# Altium project Master-Board-v2.0.PrjPcb (part 7 of 11)

## Sheet CAN-Sheet.SchDoc
size 420 x 297 mm; SheetNumber: 10; SheetTotal: 15
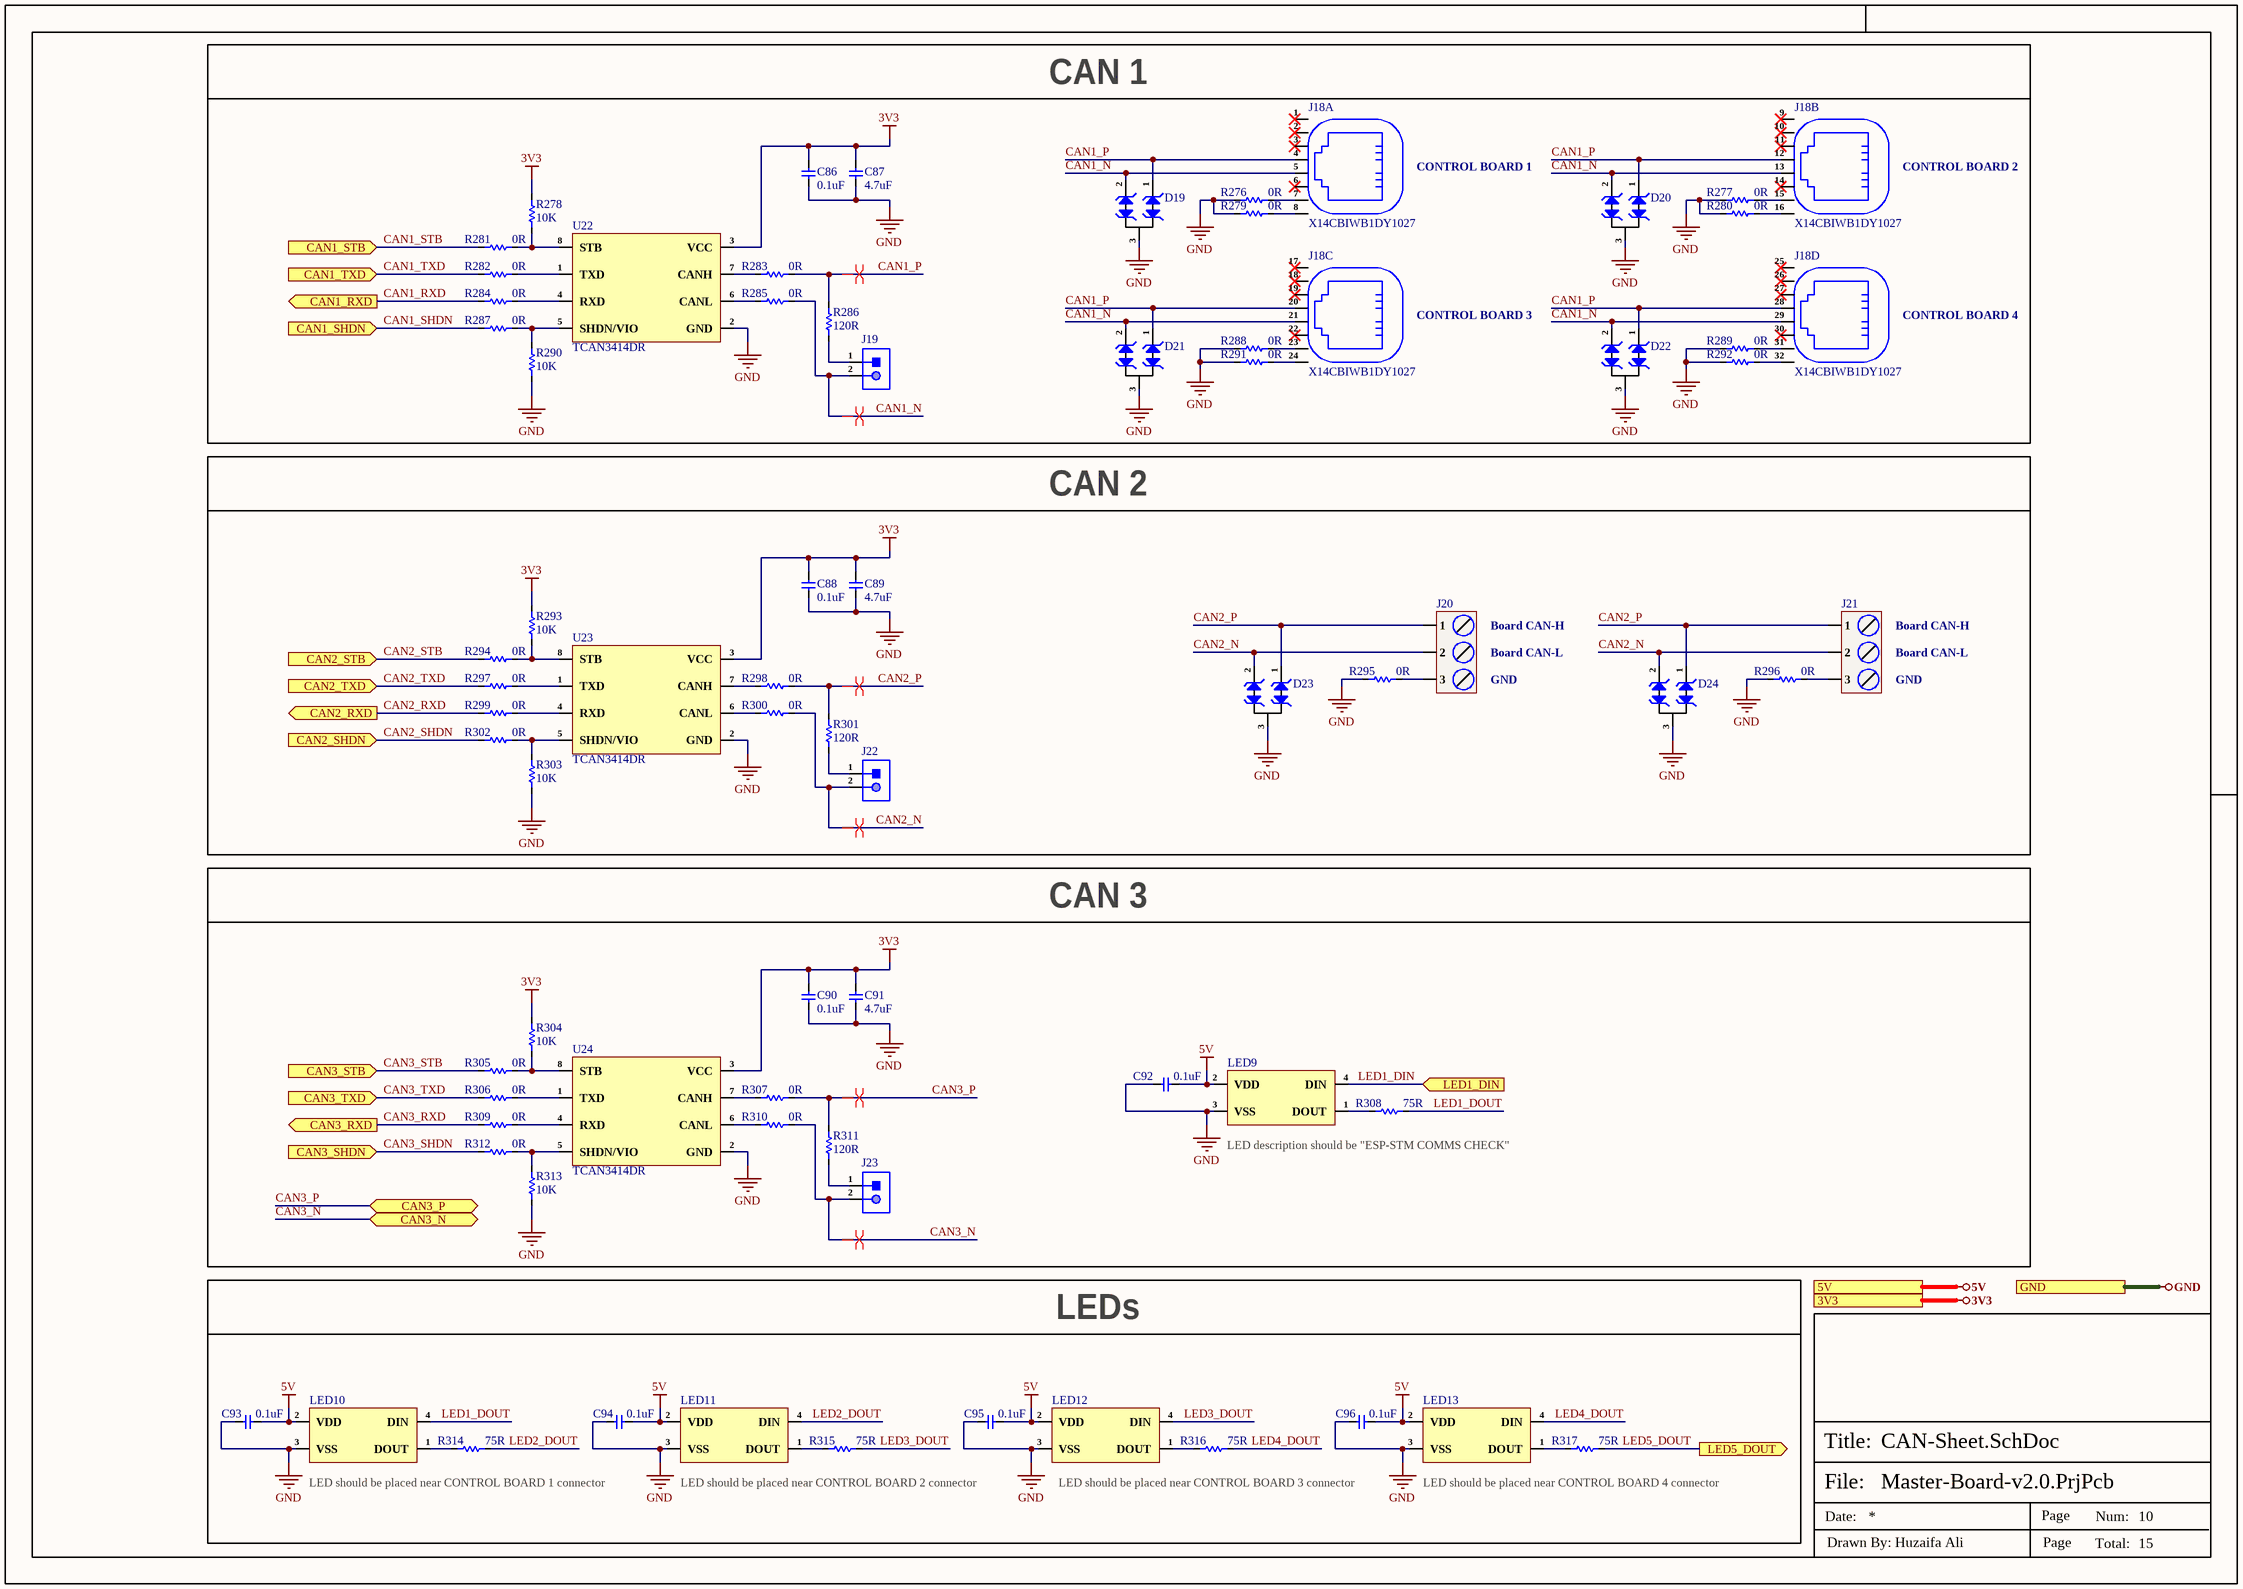
[diagram p6: CAN-Sheet.SchDoc]

### Parts
C86  0.1uF  [Cap-0402]
C87  4.7uF  [Cap-0402]
C88  0.1uF  [Cap-0402]
C89  4.7uF  [Cap-0402]
C90  0.1uF  [Cap-0402]
C91  4.7uF  [Cap-0402]
C92  0.1uF  [Cap-0402]
C93  0.1uF  [Cap-0402]
C94  0.1uF  [Cap-0402]
C95  0.1uF  [Cap-0402]
C96  0.1uF  [Cap-0402]
D19  CDSOT23-T24CAN-Q  [SOT-23]  (value not drawn)
D20  CDSOT23-T24CAN-Q  [SOT-23]  (value not drawn)
D21  CDSOT23-T24CAN-Q  [SOT-23]  (value not drawn)
D22  CDSOT23-T24CAN-Q  [SOT-23]  (value not drawn)
D23  CDSOT23-T24CAN-Q  [SOT-23]  (value not drawn)
D24  CDSOT23-T24CAN-Q  [SOT-23]  (value not drawn)
J18  X14CBIWB1DY1027  [X14CBIWB1DY1027]  (parts A,B,C,D of 4)
J19  X6511WV-02H-C60D30  [HDR1X2_]  (value not drawn)
J20  DB128L-5.08-3P-BK-S  [DB128L-5.08-3P-BK-S]  (value not drawn)
J21  DB128L-5.08-3P-BK-S  [DB128L-5.08-3P-BK-S]  (value not drawn)
J22  X6511WV-02H-C60D30  [HDR1X2_]  (value not drawn)
J23  X6511WV-02H-C60D30  [HDR1X2_]  (value not drawn)
LED9  WS2812D-F5  [WS2812D-F5]  (value not drawn)
LED10  WS2812D-F5  [WS2812D-F5]  (value not drawn)
LED11  WS2812D-F5  [WS2812D-F5]  (value not drawn)
LED12  WS2812D-F5  [WS2812D-F5]  (value not drawn)
LED13  WS2812D-F5  [WS2812D-F5]  (value not drawn)
R276  0R  [Res-0402]
R277  0R  [Res-0402]
R278  10K  [Res-0402]
R279  0R  [Res-0402]
R280  0R  [Res-0402]
R281  0R  [Res-0402]
R282  0R  [Res-0402]
R283  0R  [Res-0402]
R284  0R  [Res-0402]
R285  0R  [Res-0402]
R286  120R  [Res-0603]
R287  0R  [Res-0402]
R288  0R  [Res-0402]
R289  0R  [Res-0402]
R290  10K  [Res-0402]
R291  0R  [Res-0402]
R292  0R  [Res-0402]
R293  10K  [Res-0402]
R294  0R  [Res-0402]
R295  0R  [Res-0402]
R296  0R  [Res-0402]
R297  0R  [Res-0402]
R298  0R  [Res-0402]
R299  0R  [Res-0402]
R300  0R  [Res-0402]
R301  120R  [Res-0603]
R302  0R  [Res-0402]
R303  10K  [Res-0402]
R304  10K  [Res-0402]
R305  0R  [Res-0402]
R306  0R  [Res-0402]
R307  0R  [Res-0402]
R308  75R  [Res-0402]
R309  0R  [Res-0402]
R310  0R  [Res-0402]
R311  120R  [Res-0603]
R312  0R  [Res-0402]
R313  10K  [Res-0402]
R314  75R  [Res-0402]
R315  75R  [Res-0402]
R316  75R  [Res-0402]
R317  75R  [Res-0402]
U22  TCAN3414DR  [SOIC-8(0.154", 3.90mm Width)]
U23  TCAN3414DR  [SOIC-8(0.154", 3.90mm Width)]
U24  TCAN3414DR  [SOIC-8(0.154", 3.90mm Width)]

### Blocks framed on the sheet
CAN 1: C86 C87 D19-D22 J18 J19 R276-R292 U22
CAN 2: C88 C89 D23 D24 J20-J22 R293-R303 U23
CAN 3: C90-C92 J23 LED9 R304-R313 U24
LEDs: C93-C96 LED10-LED13 R314-R317

### Ports
3V3 (see Top-Sheet[2C], Controller-Sheet-1[4D], Controller-Sheet-2[4D], Controller-Sheet-3[4D], DIOs-Lights-Sensors-Sheet[4D], Display-Sheet[5D], ESP32_Sheet[6D], EtherCAT-Sheet[1D], Ethernet-Sheet[5D], Power-Sheet[4D], RS232-Sheet[5D], RS485-Sheet[5D], STM32-USB-Sheet[4D]), 5V (see Top-Sheet[2C], Analog-AIO-Sheet[5D], Controller-Sheet-2[4D], Controller-Sheet-3[4D], DIOs-Lights-Sensors-Sheet[4D], Display-Sheet[5D], Power-Sheet[4D], RS232-Sheet[5D], RS485-Sheet[5D], STM32-USB-Sheet[4D]), CAN1_RXD (out, see Top-Sheet[2C]), CAN1_SHDN (in, see Top-Sheet[2C]), CAN1_STB (in, see Top-Sheet[2C]), CAN1_TXD (in, see Top-Sheet[2C]), CAN2_RXD (out, see Top-Sheet[2D]), CAN2_SHDN (in, see Top-Sheet[2C]), CAN2_STB (in, see Top-Sheet[2D]), CAN2_TXD (in, see Top-Sheet[2D]), CAN3_N (bidir, see Top-Sheet[2C]), CAN3_P (bidir, see Top-Sheet[2C]), CAN3_RXD (out, see Top-Sheet[2D]), CAN3_SHDN (in, see Top-Sheet[2D]), CAN3_STB (in, see Top-Sheet[2D]), CAN3_TXD (in, see Top-Sheet[2D]), GND (see Top-Sheet[2C], Analog-AIO-Sheet[5D], Controller-Sheet-1[4D], Controller-Sheet-2[4D], Controller-Sheet-3[4D], DIOs-Lights-Sensors-Sheet[4D], Display-Sheet[5D], ESP32_Sheet[6D], EtherCAT-Sheet[1D], Ethernet-Sheet[5D], Power-Sheet[4D], RS232-Sheet[5D], RS485-Sheet[5D], STM32-USB-Sheet[4D]), LED1_DIN (in, see Top-Sheet[2D]), LED5_DOUT (out, see Top-Sheet[2D], RS232-Sheet[5B])

### Nets
3V3: C86.2 C87.2 C88.2 C89.2 C90.2 C91.2 R278.2 R293.2 R304.2 U22.3(VCC) U23.3(VCC) U24.3(VCC) ; port 3V3
5V: C92.2 C93.2 C94.2 C95.2 C96.2 LED9.2(VDD) LED10.2(VDD) LED11.2(VDD) LED12.2(VDD) LED13.2(VDD) ; port 5V
GND: C86.1 C87.1 C88.1 C89.1 C90.1 C91.1 C92.1 C93.1 C94.1 C95.1 C96.1 D19.3 D20.3 D21.3 D22.3 D23.3 D24.3 LED9.3(VSS) LED10.3(VSS) LED11.3(VSS) LED12.3(VSS) LED13.3(VSS) R276.1 R277.1 R279.1 R280.1 R288.1 R289.1 R290.1 R291.1 R292.1 R295.1 R296.1 R303.1 R313.1 U22.2(GND) U23.2(GND) U24.2(GND) ; port GND
CAN1_N: D19.2 D20.2 D21.2 D22.2 J18.5 J18.13 J18.21 J18.29 J19.2 R285.2
CAN1_P: D19.1 D20.1 D21.1 D22.1 J18.4 J18.12 J18.20 J18.28 R283.2 R286.2
CAN1_RXD: R284.1 ; port CAN1_RXD
CAN1_SHDN: R287.1 ; port CAN1_SHDN
CAN1_STB: R281.1 ; port CAN1_STB
CAN1_TXD: R282.1 ; port CAN1_TXD
CAN2_N: D23.2 D24.2 J20.2 J21.2 J22.2 R300.2
CAN2_P: D23.1 D24.1 J20.1 J21.1 R298.2 R301.2
CAN2_RXD: R299.1 ; port CAN2_RXD
CAN2_SHDN: R302.1 ; port CAN2_SHDN
CAN2_STB: R294.1 ; port CAN2_STB
CAN2_TXD: R297.1 ; port CAN2_TXD
CAN3_N: J23.2 R310.2 ; port CAN3_N  [project net CAN0_N]
CAN3_P: R307.2 R311.2 ; port CAN3_P  [project net CAN0_P]
CAN3_RXD: R309.1 ; port CAN3_RXD
CAN3_SHDN: R312.1 ; port CAN3_SHDN
CAN3_STB: R305.1 ; port CAN3_STB
CAN3_TXD: R306.1 ; port CAN3_TXD
LED1_DIN: LED9.4(DIN) ; port LED1_DIN
LED1_DOUT: LED10.4(DIN) R308.2
LED2_DOUT: LED11.4(DIN) R314.2
LED3_DOUT: LED12.4(DIN) R315.2
LED4_DOUT: LED13.4(DIN) R316.2
LED5_DOUT: R317.2 ; port LED5_DOUT
NetJ18_7: J18.7 R276.2
NetJ18_8: J18.8 R279.2
NetJ18_15: J18.15 R277.2
NetJ18_16: J18.16 R280.2
NetJ18_23: J18.23 R288.2
NetJ18_24: J18.24 R291.2
NetJ18_31: J18.31 R289.2
NetJ18_32: J18.32 R292.2
NetJ19_1: J19.1 R286.1
NetJ20_3: J20.3 R295.2
NetJ21_3: J21.3 R296.2
NetJ22_1: J22.1 R301.1
NetJ23_1: J23.1 R311.1
NetLED9_1: LED9.1(DOUT) R308.1
NetLED10_1: LED10.1(DOUT) R314.1
NetLED11_1: LED11.1(DOUT) R315.1
NetLED12_1: LED12.1(DOUT) R316.1
NetLED13_1: LED13.1(DOUT) R317.1
NetR278_1: R278.1 R281.2 U22.8(STB)
NetR282_2: R282.2 U22.1(TXD)
NetR283_1: R283.1 U22.7(CANH)
NetR284_2: R284.2 U22.4(RXD)
NetR285_1: R285.1 U22.6(CANL)
NetR287_2: R287.2 R290.2 U22.5(SHDN/VIO)
NetR293_1: R293.1 R294.2 U23.8(STB)
NetR297_2: R297.2 U23.1(TXD)
NetR298_1: R298.1 U23.7(CANH)
NetR299_2: R299.2 U23.4(RXD)
NetR300_1: R300.1 U23.6(CANL)
NetR302_2: R302.2 R303.2 U23.5(SHDN/VIO)
NetR304_1: R304.1 R305.2 U24.8(STB)
NetR306_2: R306.2 U24.1(TXD)
NetR307_1: R307.1 U24.7(CANH)
NetR309_2: R309.2 U24.4(RXD)
NetR310_1: R310.1 U24.6(CANL)
NetR312_2: R312.2 R313.2 U24.5(SHDN/VIO)

Not connected (* = marked no-connect by the designer): J18 1* 2* 3* 6* 9* 10* 11* 14* 17* 18* 19* 22* 25* 26* 27* 30*

### Layout directives
differential pair; differential pair class CAN: CAN0_N, CAN0_P, CAN1_N, CAN1_P, CAN2_N, CAN2_P

### Notes on the sheet
- CONTROL BOARD 1
- CONTROL BOARD 2
- CONTROL BOARD 3
- CONTROL BOARD 4
- Board CAN-H
- Board CAN-L
- GND
- LED description should be "ESP-STM COMMS CHECK"
- LED should be placed near CONTROL BOARD 1 connector
- LED should be placed near CONTROL BOARD 2 connector
- LED should be placed near CONTROL BOARD 3 connector
- LED should be placed near CONTROL BOARD 4 connector
- File:
- Title:
- Date:
- Page
- Num:
- Total:
- Drawn By: Huzaifa Ali

### Library data of the parts
C86 C88 C90 C92-C96 = CC0402JRX7R7BB104: as C30 on sheet Display-Sheet; Supplier: Digikey; Supplier Part Number: 311-1676-1-ND; Manufacturer Part Number: CC0402JRX7R7BB104; RoHS: Yes; Category: Ceramic Capacitors; Stock: 1659111; Pricing: 1=0.1, 10=0.046, 50=0.0262, 100=0.0203, 500=0.01528, 1000=0.012, 2500=0.01091, 5000=0.01004 (USD); Mounting Technology: Surface Mount; Case/Package: 0402; Case Code (Metric): 1005; Case Code (Imperial): 0402; Min Operating Temperature: -55°C; Max Operating Temperature: 125°C; Dielectric: X7R; Packaging: Tape and Reel; Package Quantity: 10000; Voltage Rating (DC): 16V; Voltage Rating: 16V; Series: CC; Construction: Flat; Length: 0.039inch; Width: 0.02inch; Height: 0.5mm; Thickness: 0.022inch; Lead Free: Lead Free; Halogen Free: Halogen Free; RoHS Compliant: Yes; ComponentLink1URL: https://datasheet.ciiva.com/13210/upy-gphc-x7r-6-3v-to-50v-8-12304-13210152.pdf?src-supplier=Mouser; ComponentLink1Description: https://datasheet.ciiva.com/13210/upy-gphc-x7r-6-3v-to-50v-8-12304-13210152.pdf?src-supplier=Mouser; LCSC Part Number: C541464
C87 C89 C91 = CC0402KRX5R6BB475: as C31 on sheet Display-Sheet; Supplier 1: Farnell; Manufacturer Part Number: CC0402KRX5R6BB475; RoHS: Yes; Category: Ceramic Capacitors; Stock 1: 20000; Pricing 1: 10000=0.02310, 50000=0.02100 (GBP); Mount: Surface Mount; Case/Package: 0402; Case Code (Imperial): 0402; Case Code (Metric): 1005; Min Operating Temperature: -55°C; Max Operating Temperature: 85°C; Packaging: Cut Tape; Capacitance: 4.7uF; Voltage Rating: 10V; RoHS Compliant: Yes; ComponentLink1URL: http://www.yageo.com/documents/recent/UPY-GPHC_X5R_4V-to-50V_25.pdf?src-supplier=Digi-Key; ComponentLink1Description: http://www.yageo.com/documents/recent/UPY-GPHC_X5R_4V-to-50V_25.pdf?src-supplier=Digi-Key; Supplier Part Number 1: 3871698; LCSC Part Number: C326586
D19-D24 = CDSOT23-T24CAN-Q: TVS DIODE 24VWM 40VC SOT23-3; Manufacturer: Bourns; Item Type: TVS Diodes; Supplier: Digikey; LCSC Part Number: C350941; Manufacturer Part Number: CDSOT23-T24CAN-Q; RoHS: Yes; Stock: 17231; Pricing: 1=0.36, 10=0.282, 100=0.1691, 500=0.15656, 1000=0.10645, 3000=0.098, 6000=0.09393, 9000=0.08454, 30000=0.08328, 75000=0.07827 (USD); RoHS Compliant: 5897YesNo; ComponentLink1URL: http://www.farnell.com/datasheets/2372435.pdf?src-supplier=Farnell; ComponentLink1Description: http://www.farnell.com/datasheets/2372435.pdf?src-supplier=Farnell; ComponentLink2URL: https://www.bourns.com/docs/Product-Datasheets/cdsot23-t24can-Q.pdf?src-supplier=Digikey; ComponentLink2Description: https://www.bourns.com/docs/Product-Datasheets/cdsot23-t24can-Q.pdf?src-supplier=Digikey; ComponentLink3URL: http://www.farnell.com/datasheets/2372435.pdf?src-supplier=Newark; ComponentLink3Description: http://www.farnell.com/datasheets/2372435.pdf?src-supplier=Newark
J18 = X14CBIWB1DY1027: RJ45Receptacle 4 Unshielded Bend-in Gold Phosphor Bronze Without LED -40℃~+85℃ Plugin Ethernet Connectors / Modular Connectors (RJ45 RJ11) ROHS; Manufacturer: XKB Connection; Manufacturer Part Number: X14CBIWB1DY1027; Package: Plugin; LCSC Part Number: C2931489; Item Type: Connectors (RJ45 RJ11); ComponentLink1Description: LCSC; ComponentLink1URL: https://www.lcsc.com/product-detail/Ethernet-Connectors-Modular-Connectors-RJ45-RJ11_XKB-Connection-X14CBIWB1DY1027_C2931489.html
J19 J22 J23 = X6511WV-02H-C60D30: Gold 250V 3A Straight Square Pins 2.5mm 2P 260℃ 6mm -40℃~+105℃ 3mm 2.54mm Plugin Black Brass 1x2P Plugin,P=2.54mm Pin Headers ROHS; Manufacturer: XKB; Item Type: Male Header; Manufacturer Part Number: X6511WV-02H-C60D30; Package: Plugin,P=2.54mm; LCSC Part Number: C706874; ComponentLink1Description: LCSC; ComponentLink1URL: https://www.lcsc.com/product-detail/Pin-Headers_XKB-Connectivity-X6511WV-02H-C60D30_C706874.html
J20 J21 = DB128L-5.08-3P-BK-S: 1x3P 18A -40℃~+105℃ 250V Black 12~30 Straight pin 5.08mm 2.5 1 3 Plugin,P=5.08mm Screw terminal ROHS; Manufacturer: DIBO; Item Type: Terminal Block; Manufacturer Part Number: DB128L-5.08-3P-BK-S; Package: Plugin,P=5.08mm; LCSC Part Number: C430602; ComponentLink1Description: LCSC; ComponentLink1URL: https://www.lcsc.com/product-detail/Screw-terminal_DIBO-DB128L-5-08-3P-BK-S_C430602.html
LED9-LED13 = WS2812D-F5: Plugin,D=5mm RGB LEDs ROHS; Manufacturer: Worldsemi; Item Type: RGB LED; Manufacturer Part Number: WS2812D-F5; Package: Plugin,D=5mm; LCSC Part Number: C190565; ComponentLink1Description: LCSC; ComponentLink1URL: https://jlcpcb.com/partdetail/Worldsemi-WS2812DF5/C190565
R276 R277 R279-R285 R287-R289 R291 R292 R294-R300 R302 R305-R307 R309 R310 R312 = RC0402FR-070RL: as R77-R83 on sheet Display-Sheet; Supplier 1: Mouser; Manufacturer Part Number: RC0402FR-070RL; RoHS: Yes; Stock 1: 8556842; Pricing 1: 1=0.10000, 10=0.01400, 50=0.01400, 100=0.00600, 1000=0.00300, 5000=0.00200, 10000=0.00100 (USD); Mount: Surface Mount; Case/Package: 0402; Contact Plating: Tin,Matte; Case Code (Imperial): 0402; Case Code (Metric): 1005; Size Code: 0402; Min Operating Temperature: -55°C; Max Operating Temperature: 155°C; Resistance: 0R; Resistor Type: Thick Film; Packaging: Tape and Reel; Termination: SMD/SMT; Features: Moisture Resistant; Series: RC; Number of Terminations: 2; Length: 1mm; Width: 0.5mm; Height: 0.35mm; Radiation Hardening: No; Lead Free: Lead Free; RoHS Compliant: Yes; ComponentLink1URL: https://datasheet.ciiva.com/8896/pyu-rc0402-51-rohs-l-6-8896149.pdf?src-supplier=Avnet; ComponentLink1Description: https://datasheet.ciiva.com/8896/pyu-rc0402-51-rohs-l-6-8896149.pdf?src-supplier=Avnet; ComponentLink2URL: https://datasheet.ciiva.com/16790/pyu-rc0402-51-rohs-l-6-r-16790444.pdf?src-supplier=Future+Electronics; ComponentLink2Description: https://datasheet.ciiva.com/16790/pyu-rc0402-51-rohs-l-6-r-16790444.pdf?src-supplier=Future+Electronics; Supplier Part Number 1: 603-RC0402FR-070RL; LCSC Part Number: C106231
R278 R290 R293 R303 R304 R313 = RC0402FR-0710KL: as R84 on sheet Display-Sheet; Supplier 1: Mouser; Manufacturer Part Number: RC0402FR-0710KL; RoHS: Yes; Category: Chip SMD Resistors; Stock 1: 18648329; Pricing 1: 1=0.10000, 10=0.01400, 50=0.01400, 100=0.00500, 1000=0.00300, 10000=0.00200 (USD); Case/Package: 0402; Number of Pins: 2; Case Code (Imperial): 0402; Case Code (Metric): 1005; Min Operating Temperature: -55°C; Max Operating Temperature: 155°C; Resistor Type: Thick Film; Tolerance: 1%; Packaging: Tape and Reel; Voltage Rating: 50V; Termination: SMD/SMT; Working Voltage: 50V; Number of Terminations: 2; Features: Moisture Resistant; Series: RC; Resistance Tolerance: 1%; Construction: Rectangular; Length: 1mm; Width: 0.5mm; Height: 0.32mm; Depth: 0.5mm; Lead Pitch: 0.2mm; REACH SVHC: No SVHC; Lead Free: Lead Free; RoHS Compliant: Yes; Military Standard: Not; ComponentLink1URL: https://datasheet.ciiva.com/7660/38568-7660787.pdf?src-supplier=Element14; ComponentLink1Description: https://datasheet.ciiva.com/7660/38568-7660787.pdf?src-supplier=Element14; ComponentLink2URL: https://datasheet.ciiva.com/7849/1686128-7849814.pdf?src-supplier=Element14; ComponentLink2Description: https://datasheet.ciiva.com/7849/1686128-7849814.pdf?src-supplier=Element14; ComponentLink3URL: https://datasheet.ciiva.com/7983/1018594-7983486.pdf?src-supplier=Element14; ComponentLink3Description: https://datasheet.ciiva.com/7983/1018594-7983486.pdf?src-supplier=Element14; ComponentLink4URL: https://datasheet.ciiva.com/22747/1018594-22747512.pdf?src-supplier=Element14; ComponentLink4Description: https://datasheet.ciiva.com/22747/1018594-22747512.pdf?src-supplier=Element14; ComponentLink5URL: https://datasheet.ciiva.com/12667/pyu-rc0402-51-rohs-l-6-r-12667067.pdf?src-supplier=Mouser; ComponentLink5Description: https://datasheet.ciiva.com/12667/pyu-rc0402-51-rohs-l-6-r-12667067.pdf?src-supplier=Mouser; ComponentLink6URL: https://datasheet.ciiva.com/7849/1784430-7849813.pdf?src-supplier=Element14; ComponentLink6Description: https://datasheet.ciiva.com/7849/1784430-7849813.pdf?src-supplier=Element14; ComponentLink7URL: https://datasheet.ciiva.com/7849/1784430-7849815.pdf?src-supplier=Element14; ComponentLink7Description: https://datasheet.ciiva.com/7849/1784430-7849815.pdf?src-supplier=Element14; Supplier Part Number 1: 603-RC0402FR-0710KL; LCSC Part Number: C60490
R286 R301 R311 = RC0603FR-07120RL: RES 120 OHM 1% 1/10W 0603; Manufacturer: Yageo; Temperature Coefficient: 100ppm/°C; Voltage Rating (DC): 50V; Power Rating: 100mW; Item Type: Resistor; Supplier 1: Digi-Key; Manufacturer Part Number: RC0603FR-07120RL; RoHS: Yes; Category: Chip SMD Resistors; Stock 1: 839061; Pricing 1: 1=0.10000, 10=0.02400, 100=0.00970, 1000=0.00436, 2500=0.00378 (USD); Case/Package: 0603; Number of Pins: 2; Case Code (Metric): 1608; Case Code (Imperial): 0603; Size Code: 0603; Min Operating Temperature: -55°C; Max Operating Temperature: 155°C; Resistance: 120R; Tolerance: 1%; Resistor Type: Thick Film; Packaging: Tape and Reel; Voltage Rating: 50V; Package Quantity: 1; Number of Terminations: 2; Termination: SMD/SMT; Max Power Dissipation: 100mW; Features: Moisture Resistant; Series: RC; Construction: Rectangular; Resistance Tolerance: 1%; Length: 1.6mm; Width: 0.031inch; Height: 0.022inch; Depth: 0.8mm; REACH SVHC: No SVHC; Lead Free: Lead Free; Military Standard: Not; RoHS Compliant: Yes; ComponentLink1URL: https://datasheet.ciiva.com/2553/pyu-r-int-thick-7-2553512.pdf?src-supplier=Digi-Key; ComponentLink1Description: https://datasheet.ciiva.com/2553/pyu-r-int-thick-7-2553512.pdf?src-supplier=Digi-Key; ComponentLink2URL: https://datasheet.ciiva.com/7746/443971-7746248.pdf?src-supplier=Element14; ComponentLink2Description: https://datasheet.ciiva.com/7746/443971-7746248.pdf?src-supplier=Element14; ComponentLink3URL: https://datasheet.ciiva.com/2553/pyu-r-int-thick-7-2553513.pdf?src-supplier=Digi-Key; ComponentLink3Description: https://datasheet.ciiva.com/2553/pyu-r-int-thick-7-2553513.pdf?src-supplier=Digi-Key; ComponentLink4URL: https://datasheet.ciiva.com/7746/443971-7746249.pdf?src-supplier=Element14; ComponentLink4Description: https://datasheet.ciiva.com/7746/443971-7746249.pdf?src-supplier=Element14; ComponentLink5URL: https://datasheet.ciiva.com/2553/pyu-r-int-thick-7-2553514.pdf?src-supplier=Digi-Key; ComponentLink5Description: https://datasheet.ciiva.com/2553/pyu-r-int-thick-7-2553514.pdf?src-supplier=Digi-Key; ComponentLink6URL: https://datasheet.ciiva.com/46395/443971-46395021.pdf?src-supplier=Element14; ComponentLink6Description: https://datasheet.ciiva.com/46395/443971-46395021.pdf?src-supplier=Element14; Supplier Part Number 1: 311-120HRCT-ND; LCSC Part Number: C114640
R308 R314-R317 = RC0402JR-0775RL: as R202 on sheet Controller-Sheet-2; Supplier: Digikey; Supplier Part Number: 311-75JRCT-ND; Manufacturer Part Number: RC0402JR-0775RL; RoHS: Yes; Stock: 2993323; Pricing: 1=0.1, 10=0.018, 50=0.0102, 100=0.0083, 500=0.00528, 1000=0.00444, 5000=0.00307 (USD); Case/Package: 0402; Pins: 2; Contact Plating: Tin,Lead; Case Code (Imperial): 0402; Case Code (Metric): 1005; Min Operating Temperature: -55°C; Max Operating Temperature: 155°C; Value: 75R; Tolerance: 5%; Resistor Type: Thick Film; Packaging: Tape and Reel; Termination: SMD/SMT; Voltage Rating (DC): 50V; Features: Moisture Resistant; Series: RC; Number of Terminations: 2; Resistance Tolerance: 5%; Length: 1mm; Width: 0.5mm; Height: 0.35mm; Reach SVHC Compliant: No; Lead Free: Lead Free; RoHS Compliant: Yes; ComponentLink1URL: https://datasheet.ciiva.com/7983/1018594-7983612.pdf?src-supplier=Element14; ComponentLink1Description: https://datasheet.ciiva.com/7983/1018594-7983612.pdf?src-supplier=Element14; ComponentLink2URL: https://datasheet.ciiva.com/17082/pyu-rc0402-51-rohs-l-6-r-17082239.pdf?src-supplier=Future+Electronics; ComponentLink2Description: https://datasheet.ciiva.com/17082/pyu-rc0402-51-rohs-l-6-r-17082239.pdf?src-supplier=Future+Electronics; LCSC Part Number: C137841
U22-U24 = TCAN3414DR: IC TRANSCEIVER HALF 1/1 8SOIC; Manufacturer: Texas Instruments; Supplier: Mouser; LCSC Part Number: C22396693; Manufacturer Part Number: TCAN3414DR; RoHS: No; Item Type: IC; Stock: 201; Pricing: 1=1.55, 10=1.1, 50=1.1, 100=0.895, 1000=0.763, 10000=0.681 (USD); Case/Package: SOIC; Pins: 8; Length: 4.9mm; Width: 3.91mm; Height: 1.75mm; Thickness: 1.58mm

## Sheet DIOs-Lights-Sensors-Sheet.SchDoc
size 420 x 297 mm; SheetNumber: 14; SheetTotal: 15
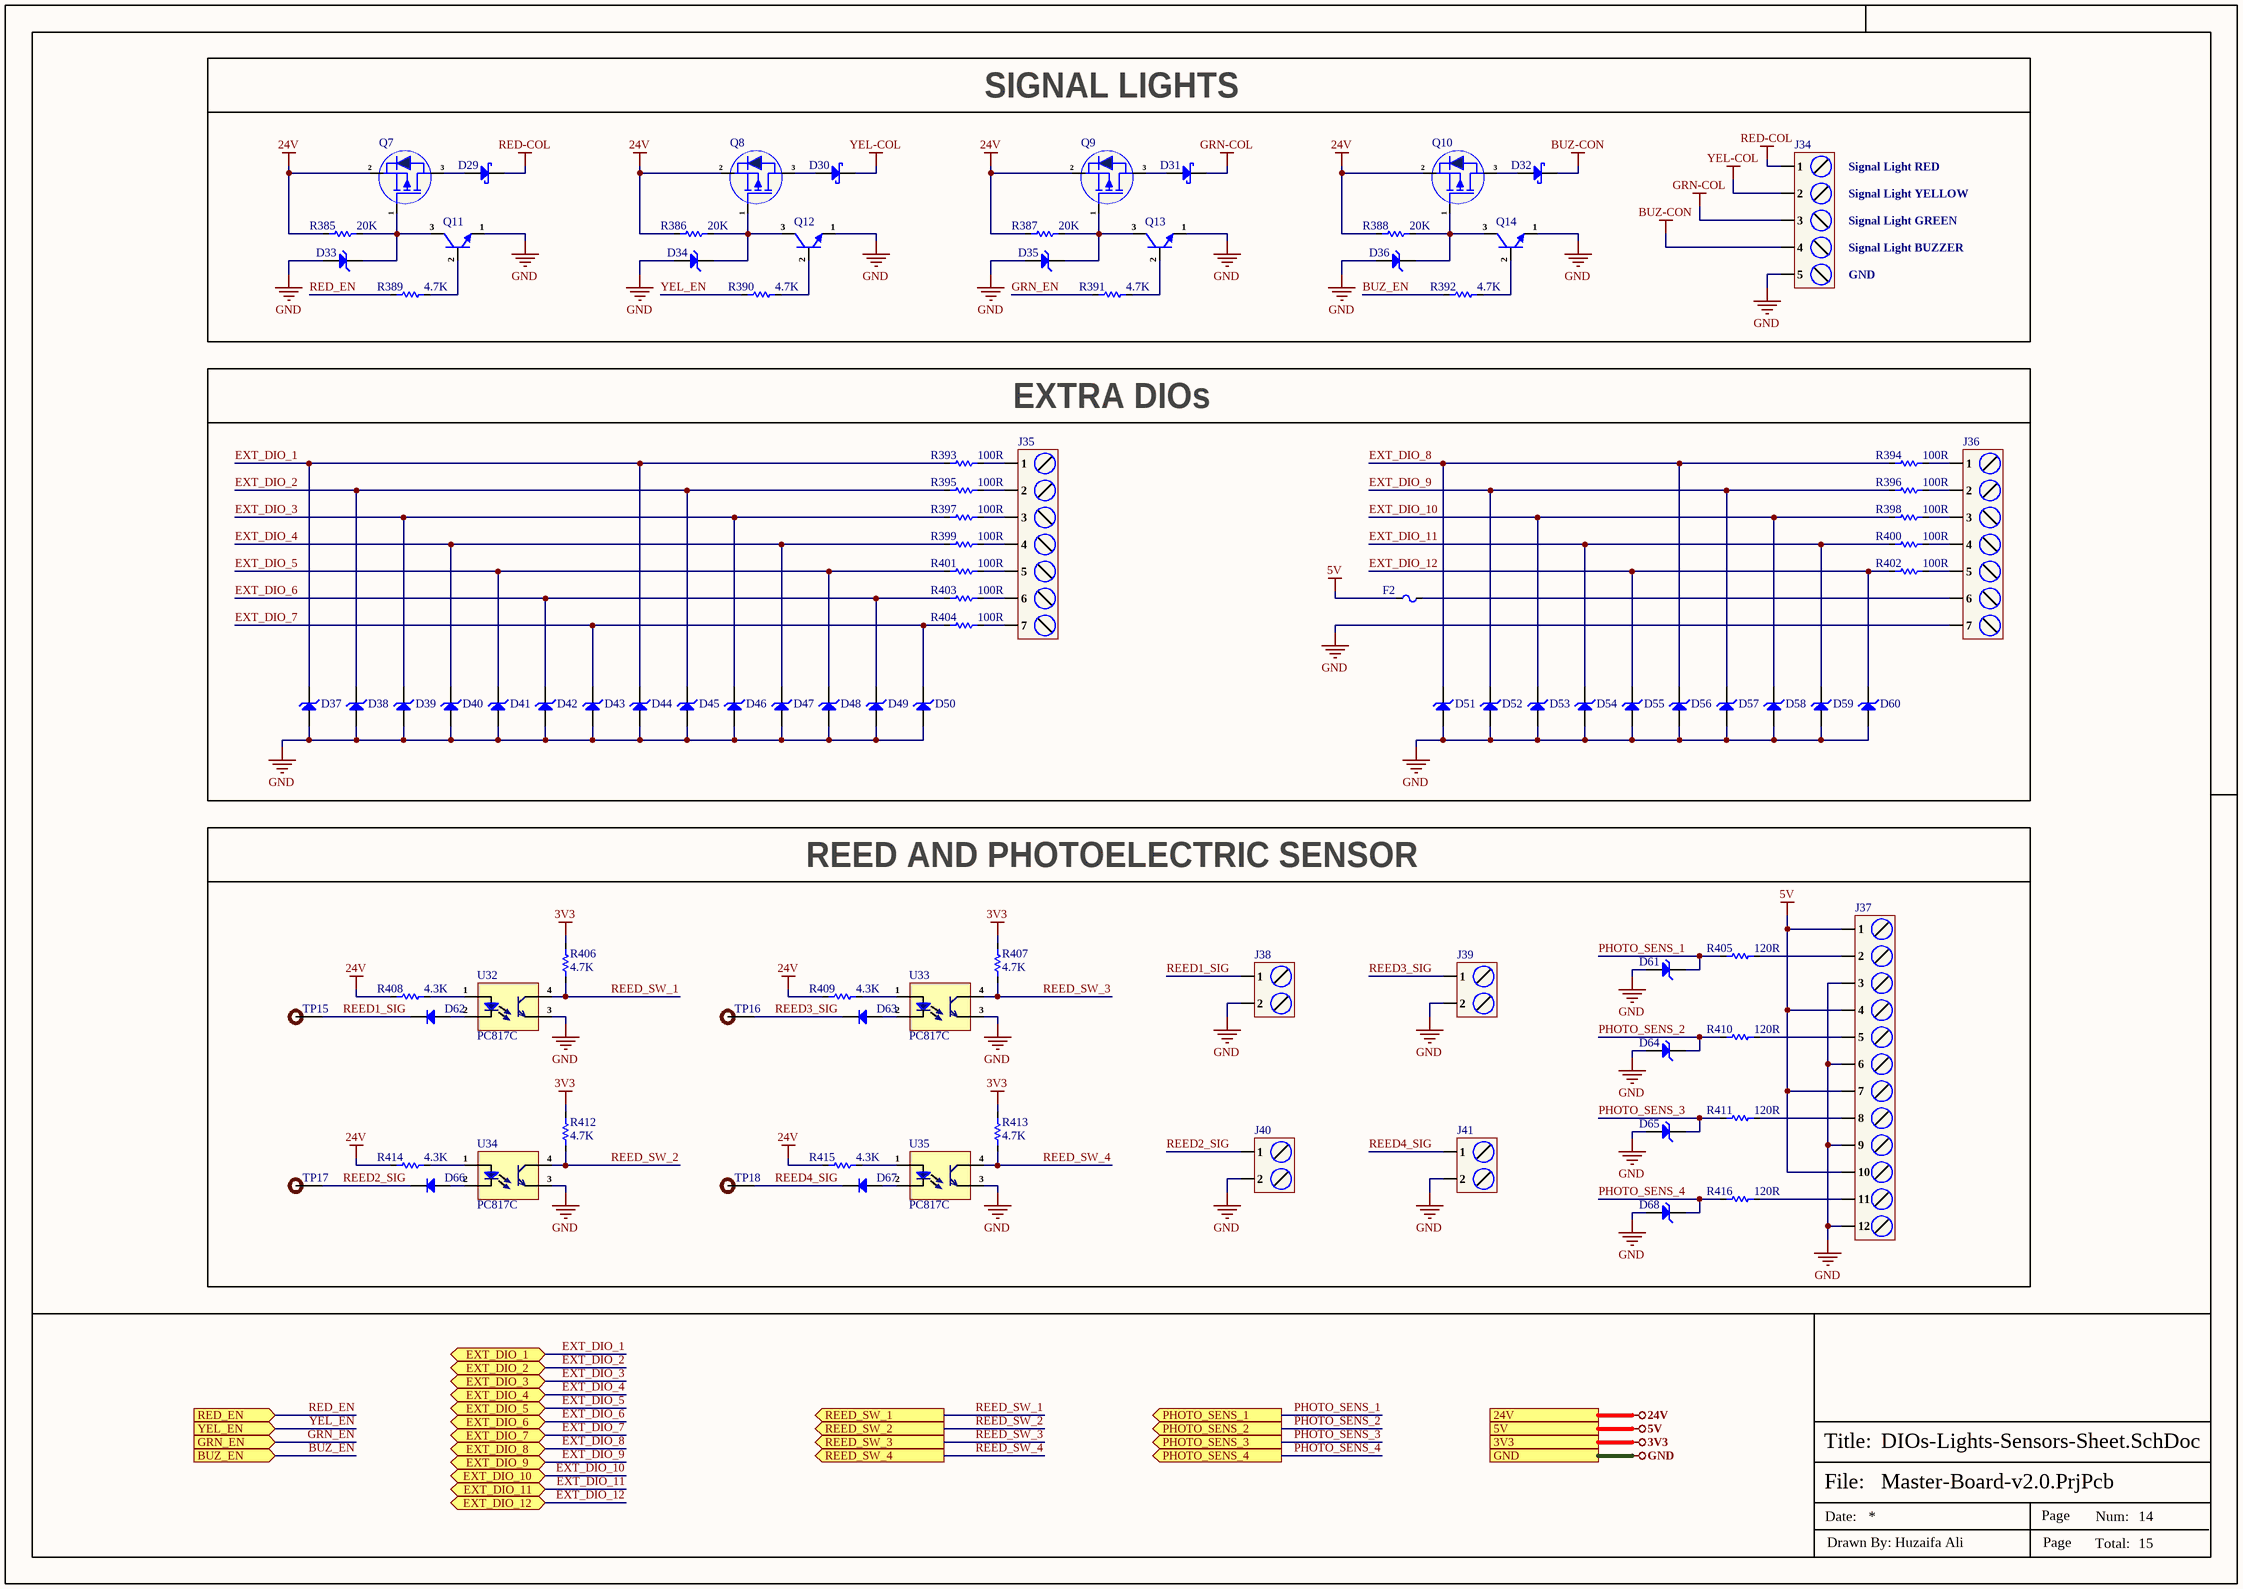
[diagram p7: DIOs-Lights-Sensors-Sheet.SchDoc]

### Parts
D29  SS16  [SMA]  (value not drawn)
D30  SS16  [SMA]  (value not drawn)
D31  SS16  [SMA]  (value not drawn)
D32  SS16  [SMA]  (value not drawn)
D33  1SMA5930BT3G  [SMA]  (value not drawn)
D34  1SMA5930BT3G  [SMA]  (value not drawn)
D35  1SMA5930BT3G  [SMA]  (value not drawn)
D36  1SMA5930BT3G  [SMA]  (value not drawn)
D37  MM3Z3V3B  [SOD323F]  (value not drawn)
D38  MM3Z3V3B  [SOD323F]  (value not drawn)
D39  MM3Z3V3B  [SOD323F]  (value not drawn)
D40  MM3Z3V3B  [SOD323F]  (value not drawn)
D41  MM3Z3V3B  [SOD323F]  (value not drawn)
D42  MM3Z3V3B  [SOD323F]  (value not drawn)
D43  MM3Z3V3B  [SOD323F]  (value not drawn)
D44  AZ3003-01G  [SOD-123]  (value not drawn)
D45  AZ3003-01G  [SOD-123]  (value not drawn)
D46  AZ3003-01G  [SOD-123]  (value not drawn)
D47  AZ3003-01G  [SOD-123]  (value not drawn)
D48  AZ3003-01G  [SOD-123]  (value not drawn)
D49  AZ3003-01G  [SOD-123]  (value not drawn)
D50  AZ3003-01G  [SOD-123]  (value not drawn)
D51  MM3Z3V3B  [SOD323F]  (value not drawn)
D52  MM3Z3V3B  [SOD323F]  (value not drawn)
D53  MM3Z3V3B  [SOD323F]  (value not drawn)
D54  MM3Z3V3B  [SOD323F]  (value not drawn)
D55  MM3Z3V3B  [SOD323F]  (value not drawn)
D56  AZ3003-01G  [SOD-123]  (value not drawn)
D57  AZ3003-01G  [SOD-123]  (value not drawn)
D58  AZ3003-01G  [SOD-123]  (value not drawn)
D59  AZ3003-01G  [SOD-123]  (value not drawn)
D60  AZ3003-01G  [SOD-123]  (value not drawn)
D61  MM3Z3V3B  [SOD323F]  (value not drawn)
D62  1N4148W-7-F  [SOD-123]  (value not drawn)
D63  1N4148W-7-F  [SOD-123]  (value not drawn)
D64  MM3Z3V3B  [SOD323F]  (value not drawn)
D65  MM3Z3V3B  [SOD323F]  (value not drawn)
D66  1N4148W-7-F  [SOD-123]  (value not drawn)
D67  1N4148W-7-F  [SOD-123]  (value not drawn)
D68  MM3Z3V3B  [SOD323F]  (value not drawn)
F2  SMD0603-050  [Fuse-0603]  (value not drawn)
J34  DB128V-5.08-5P-GN-S  [DB128V-5.08-5P-GN-S]  (value not drawn)
J35  DB128V-5.08-7P-GN-S  [DB128V-5.08-7P-GN-S]  (value not drawn)
J36  DB128V-5.08-7P-GN-S  [DB128V-5.08-7P-GN-S]  (value not drawn)
J37  DB128V-5.08-12P-GN-S  [DB128V-5.08-12P-GN-S]  (value not drawn)
J38  DB128L-5.08-2P-OG-S  [DB128L-5.08-2P-OG-S]  (value not drawn)
J39  DB128L-5.08-2P-GY-S  [DB128L-5.08-2P-GY-S]  (value not drawn)
J40  DB128L-5.08-2P-GN-S  [DB128L-5.08-2P-GN-S]  (value not drawn)
J41  DB128L-5.08-2P-BK-S  [DB128L-5.08-2P-BK-S]  (value not drawn)
Q7  AO3401  [SOT-23]  (value not drawn)
Q8  AO3401  [SOT-23]  (value not drawn)
Q9  AO3401  [SOT-23]  (value not drawn)
Q10  AO3401  [SOT-23]  (value not drawn)
Q11  MMBT3904  [SOT-23]  (value not drawn)
Q12  MMBT3904  [SOT-23]  (value not drawn)
Q13  MMBT3904  [SOT-23]  (value not drawn)
Q14  MMBT3904  [SOT-23]  (value not drawn)
R385  20K  [Res-0402]
R386  20K  [Res-0402]
R387  20K  [Res-0402]
R388  20K  [Res-0402]
R389  4.7K  [Res-0402]
R390  4.7K  [Res-0402]
R391  4.7K  [Res-0402]
R392  4.7K  [Res-0402]
R393  100R  [Res-0402]
R394  100R  [Res-0402]
R395  100R  [Res-0402]
R396  100R  [Res-0402]
R397  100R  [Res-0402]
R398  100R  [Res-0402]
R399  100R  [Res-0402]
R400  100R  [Res-0402]
R401  100R  [Res-0402]
R402  100R  [Res-0402]
R403  100R  [Res-0402]
R404  100R  [Res-0402]
R405  120R  [Res-0603]
R406  4.7K  [Res-0402]
R407  4.7K  [Res-0402]
R408  4.3K  [Res-0402]
R409  4.3K  [Res-0402]
R410  120R  [Res-0603]
R411  120R  [Res-0603]
R412  4.7K  [Res-0402]
R413  4.7K  [Res-0402]
R414  4.3K  [Res-0402]
R415  4.3K  [Res-0402]
R416  120R  [Res-0603]
TP15  TEST POINT  [Test-point]  (value not drawn)  (no BOM)
TP16  TEST POINT  [Test-point]  (value not drawn)  (no BOM)
TP17  TEST POINT  [Test-point]  (value not drawn)  (no BOM)
TP18  TEST POINT  [Test-point]  (value not drawn)  (no BOM)
U32  PC817C  [PC817C]
U33  PC817C  [PC817C]
U34  PC817C  [PC817C]
U35  PC817C  [PC817C]

### Blocks framed on the sheet
SIGNAL LIGHTS: D29-D36 J34 Q7-Q14 R385-R392
EXTRA DIOs: D37-D60 F2 J35 J36 R393-R404
REED AND PHOTOELECTRIC SENSOR: D61-D68 J37-J41 R405-R416 TP15-TP18 U32-U35

### Ports
3V3 (see Top-Sheet[5C], CAN-Sheet[5D], Controller-Sheet-1[4D], Controller-Sheet-2[4D], Controller-Sheet-3[4D], Display-Sheet[5D], ESP32_Sheet[6D], EtherCAT-Sheet[1D], Ethernet-Sheet[5D], Power-Sheet[4D], RS232-Sheet[5D], RS485-Sheet[5D], STM32-USB-Sheet[4D]), 5V (see Top-Sheet[5C], Analog-AIO-Sheet[5D], CAN-Sheet[5D], Controller-Sheet-2[4D], Controller-Sheet-3[4D], Display-Sheet[5D], Power-Sheet[4D], RS232-Sheet[5D], RS485-Sheet[5D], STM32-USB-Sheet[4D]), 24V (see Top-Sheet[5B], Power-Sheet[4D]), BUZ_EN (in, see Top-Sheet[5C]), EXT_DIO_1 (bidir, see Top-Sheet[5C]), EXT_DIO_2 (bidir, see Top-Sheet[5C]), EXT_DIO_3 (bidir, see Top-Sheet[5C]), EXT_DIO_4 (bidir, see Top-Sheet[5C]), EXT_DIO_5 (bidir, see Top-Sheet[5C]), EXT_DIO_6 (bidir, see Top-Sheet[5C]), EXT_DIO_7 (bidir, see Top-Sheet[5C]), EXT_DIO_8 (bidir, see Top-Sheet[5C]), EXT_DIO_9 (bidir, see Top-Sheet[5C]), EXT_DIO_10 (bidir, see Top-Sheet[5C]), EXT_DIO_11 (bidir, see Top-Sheet[5C]), EXT_DIO_12 (bidir, see Top-Sheet[5C]), GND (see Top-Sheet[5C], Analog-AIO-Sheet[5D], CAN-Sheet[6D], Controller-Sheet-1[4D], Controller-Sheet-2[4D], Controller-Sheet-3[4D], Display-Sheet[5D], ESP32_Sheet[6D], EtherCAT-Sheet[1D], Ethernet-Sheet[5D], Power-Sheet[4D], RS232-Sheet[5D], RS485-Sheet[5D], STM32-USB-Sheet[4D]), GRN_EN (in, see Top-Sheet[5C]), PHOTO_SENS_1 (out, see Top-Sheet[5C]), PHOTO_SENS_2 (out, see Top-Sheet[5C]), PHOTO_SENS_3 (out, see Top-Sheet[5C]), PHOTO_SENS_4 (out, see Top-Sheet[5C]), RED_EN (in, see Top-Sheet[5C]), REED_SW_1 (out, see Top-Sheet[5C]), REED_SW_2 (out, see Top-Sheet[5C]), REED_SW_3 (out, see Top-Sheet[5C]), REED_SW_4 (out, see Top-Sheet[5C]), YEL_EN (in, see Top-Sheet[5C])

### Nets
3V3: R406.2 R407.2 R412.2 R413.2 ; port 3V3
5V: F2.1 J37.1 J37.4 J37.7 J37.10 ; port 5V
24V: Q7.2(S) Q8.2(S) Q9.2(S) Q10.2(S) R385.1 R386.1 R387.1 R388.1 R408.1 R409.1 R414.1 R415.1 ; port 24V  [project net +24V]
BUZ-CON: D32.1(K) J34.4
GND: D33.2(A) D34.2(A) D35.2(A) D36.2(A) D37.1(A) D38.1(A) D39.1(A) D40.1(A) D41.1(A) D42.1(A) D43.1(A) D44.1(A) D45.1(A) D46.1(A) D47.1(A) D48.1(A) D49.1(A) D50.1(A) D51.1(A) D52.1(A) D53.1(A) D54.1(A) D55.1(A) D56.1(A) D57.1(A) D58.1(A) D59.1(A) D60.1(A) D61.1(A) D64.1(A) D65.1(A) D68.1(A) J34.5 J36.7 J37.3 J37.6 J37.9 J37.12 J38.2 J39.2 J40.2 J41.2 Q11.1(E) Q12.1(E) Q13.1(E) Q14.1(E) U32.3(E) U33.3(E) U34.3(E) U35.3(E) ; port GND
GRN-COL: D31.1(K) J34.3
RED-COL: D29.1(K) J34.1
YEL-COL: D30.1(K) J34.2
BUZ_EN: R392.1 ; port BUZ_EN
EXT_DIO_1: D37.2(K) D44.2(K) R393.1 ; port EXT_DIO_1  [project net DIO_PA0]
EXT_DIO_2: D38.2(K) D45.2(K) R395.1 ; port EXT_DIO_2  [project net DIO_PA1]
EXT_DIO_3: D39.2(K) D46.2(K) R397.1 ; port EXT_DIO_3  [project net DIO_PA2]
EXT_DIO_4: D40.2(K) D47.2(K) R399.1 ; port EXT_DIO_4  [project net DIO_PA3]
EXT_DIO_5: D41.2(K) D48.2(K) R401.1 ; port EXT_DIO_5  [project net DIO_PA6]
EXT_DIO_6: D42.2(K) D49.2(K) R403.1 ; port EXT_DIO_6  [project net DIO_PA7]
EXT_DIO_7: D43.2(K) D50.2(K) R404.1 ; port EXT_DIO_7  [project net DIO_PC0]
EXT_DIO_8: D51.2(K) D56.2(K) R394.1 ; port EXT_DIO_8  [project net DIO_PC1]
EXT_DIO_9: D52.2(K) D57.2(K) R396.1 ; port EXT_DIO_9  [project net DIO_PC4]
EXT_DIO_10: D53.2(K) D58.2(K) R398.1 ; port EXT_DIO_10  [project net DIO_PC5]
EXT_DIO_11: D54.2(K) D59.2(K) R400.1 ; port EXT_DIO_11  [project net DIO_PC8]
EXT_DIO_12: D55.2(K) D60.2(K) R402.1 ; port EXT_DIO_12  [project net DIO_PC9]
GRN_EN: R391.1 ; port GRN_EN  [project net DO_PD14]
PHOTO_SENS_1: D61.2(K) R405.1 ; port PHOTO_SENS_1  [project net DI_PG1]
PHOTO_SENS_2: D64.2(K) R410.1 ; port PHOTO_SENS_2  [project net DI_PG2]
PHOTO_SENS_3: D65.2(K) R411.1 ; port PHOTO_SENS_3  [project net DI_PG3]
PHOTO_SENS_4: D68.2(K) R416.1 ; port PHOTO_SENS_4  [project net DI_PG4]
RED_EN: R389.1 ; port RED_EN  [project net DO_PF13]
REED1_SIG: D62.2(K) J38.1 TP15.1
REED2_SIG: D66.2(K) J40.1 TP17.1
REED3_SIG: D63.2(K) J39.1 TP16.1
REED4_SIG: D67.2(K) J41.1 TP18.1
REED_SW_1: R406.1 U32.4(C) ; port REED_SW_1  [project net DI_PG0]
REED_SW_2: R412.1 U34.4(C) ; port REED_SW_2  [project net DI_PE13]
REED_SW_3: R407.1 U33.4(C) ; port REED_SW_3  [project net DI_PE14]
REED_SW_4: R413.1 U35.4(C) ; port REED_SW_4  [project net DI_PE15]
YEL_EN: R390.1 ; port YEL_EN  [project net DO_PD11]
NetD29_2: D29.2(A) Q7.3(D)
NetD30_2: D30.2(A) Q8.3(D)
NetD31_2: D31.2(A) Q9.3(D)
NetD32_2: D32.2(A) Q10.3(D)
NetD33_1: D33.1(K) Q7.1(G) Q11.3(C) R385.2
NetD34_1: D34.1(K) Q8.1(G) Q12.3(C) R386.2
NetD35_1: D35.1(K) Q9.1(G) Q13.3(C) R387.2
NetD36_1: D36.1(K) Q10.1(G) Q14.3(C) R388.2
NetD62_1: D62.1(A) U32.2(Ca)
NetD63_1: D63.1(A) U33.2(Ca)
NetD66_1: D66.1(A) U34.2(Ca)
NetD67_1: D67.1(A) U35.2(Ca)
NetF2_2: F2.2 J36.6
NetJ35_1: J35.1 R393.2
NetJ35_2: J35.2 R395.2
NetJ35_3: J35.3 R397.2
NetJ35_4: J35.4 R399.2
NetJ35_5: J35.5 R401.2
NetJ35_6: J35.6 R403.2
NetJ35_7: J35.7 R404.2
NetJ36_1: J36.1 R394.2
NetJ36_2: J36.2 R396.2
NetJ36_3: J36.3 R398.2
NetJ36_4: J36.4 R400.2
NetJ36_5: J36.5 R402.2
NetJ37_2: J37.2 R405.2
NetJ37_5: J37.5 R410.2
NetJ37_8: J37.8 R411.2
NetJ37_11: J37.11 R416.2
NetQ11_2: Q11.2(B) R389.2
NetQ12_2: Q12.2(B) R390.2
NetQ13_2: Q13.2(B) R391.2
NetQ14_2: Q14.2(B) R392.2
NetR408_2: R408.2 U32.1(An)
NetR409_2: R409.2 U33.1(An)
NetR414_2: R414.2 U34.1(An)
NetR415_2: R415.2 U35.1(An)

### Notes on the sheet
- Signal Light RED
- Signal Light YELLOW
- Signal Light GREEN
- Signal Light BUZZER
- GND
- File:
- Title:
- Date:
- Page
- Num:
- Total:
- Drawn By: Huzaifa Ali

### Library data of the parts
D29-D32 = SS16: 60V 700mV@1A 1A SMA(DO-214AC) Schottky Barrier Diodes (SBD) ROHS; Manufacturer: MDD; Item Type: Schottky Diode; Manufacturer Part Number: SS16; Package: SMA(DO-214AC); LCSC Part Number: C2481; ComponentLink1Description: LCSC; ComponentLink1URL: https://www.lcsc.com/product-detail/Schottky-Barrier-Diodes-SBD_MDD-Microdiode-Electronics-SS16_C2481.html
D33-D36 = 1SMA5930BT3G: DIODE ZENER 16V 1.5W SMA; Manufacturer: onsemi; Item Type: Zener diode; Manufacturer Part Number: 1SMA5930BT3G; Package: SMA; LCSC Part Number: C128848; ComponentLink1Description: LCSC; ComponentLink1URL: https://www.lcsc.com/product-detail/Zener-Diodes_onsemi-1SMA5930BT3G_C128848.html
D37-D43 D51-D55 D61 D64 D65 D68 = MM3Z3V3B: DIODE ZENER 3.3V 200MW SOD323F; Manufacturer: ON Semiconductor / Fairchild; Forward Voltage: 1V; Tolerance: 2%; Impedance: 89R; Max Reverse Leakage Current: 4.5uA; Test Current: 5mA; Element Configuration: Single; Supplier 1: Digi-Key; Manufacturer Part Number: MM3Z3V3B; Stock 1: 473644; Pricing 1: 1=0.22, 10=0.18, 100=0.0956, 500=0.06288, 1000=0.04276 (USD); Mount: Surface Mount; Number of Pins: 2; Weight: 0.0276g; Min Operating Temperature: -65°C; Max Operating Temperature: 150°C; Packaging: Tape and Reel; Package Quantity: 1; Max Power Dissipation: 200mW; Zener Voltage: 3.3V; Voltage Tolerance: 2%; Power Dissipation: 200mW; Working Voltage: 3.3V; Peak Reverse Current: 4.5uA; Length: 1.3mm; Height: 1mm; Width: 1.7mm; Radiation Hardening: No; REACH SVHC: No SVHC; Lead Free: Lead Free; ComponentLink1URL: http://www.onsemi.com/pub/Collateral/MM3Z9V1B-D.pdf?src-supplier=Digi-Key; ComponentLink1Description: http://www.onsemi.com/pub/Collateral/MM3Z9V1B-D.pdf?src-supplier=Digi-Key; ComponentLink2URL: http://www.mouser.com/ds/2/149/MM3Z3V3B-187166.pdf?src-supplier=Mouser; ComponentLink2Description: http://www.mouser.com/ds/2/149/MM3Z3V3B-187166.pdf?src-supplier=Mouser; ComponentLink3URL: https://www.fairchildsemi.com/datasheets/MM/MM3Z9V1B.pdf?src-supplier=Avnet; ComponentLink3Description: https://www.fairchildsemi.com/datasheets/MM/MM3Z9V1B.pdf?src-supplier=Avnet; ComponentLink4URL: http://www.farnell.com/datasheets/1706525.pdf?src-supplier=Element14; ComponentLink4Description: http://www.farnell.com/datasheets/1706525.pdf?src-supplier=Element14; Supplier Part Number 1: MM3Z3V3BCT-ND; LCSC Part Number: C2978865; Item Type: Diode
D44-D50 D56-D60 = AZ3003-01G: TVS SURGE PROTECTOR 1-CH 3.3V; Manufacturer: Amazing; Item Type: Diode; Manufacturer Part Number: AZ3003-01G; Package: SOD-123; LCSC Part Number: -; ComponentLink1Description: Digikey; ComponentLink1URL: https://www.digikey.com/en/products/detail/amazing/AZ3003-01G/16615352?s=N4IgTCBcDaIIIC0DMAGFSC0KCMBxEAugL5A
D62 D63 D66 D67 = 1N4148W-7-F: DIODE GEN PURP 100V 300MA SOD123; Manufacturer: Diodes; Forward Current: 150mA; Reverse Recovery Time: 4ns; Max Forward Surge Current (Ifsm): 2A; Element Configuration: Single; Max Reverse Current: 1uA; Forward Voltage: 1.25V; Power Dissipation: 400mW; Polarity: Standard; Voltage Rating (DC): 75V; Value: 2pF; Supplier 1: Future Electronics; Manufacturer Part Number: 1N4148W-7-F; RoHS: Yes; Category: Rectifier Diodes; Stock 1: 32931000; Pricing 1: 3000=0.01840, 12000=0.01760, 45000=0.01690, 120000=0.01640, 300000=0.01560 (USD); Mounting Technology: Surface Mount; Pins: 2; Weight: 0.000353oz; Contact Plating: Tin,Matte; Min Operating Temperature: -65°C; Max Operating Temperature: 150°C; Packaging: Tape and Reel; Max Repetitive Reverse Voltage (Vrrm): 100V; Peak Non-Repetitive Surge Current: 2A; Voltage: 100V; Max Surge Current: 2A; Package Quantity: 3000; Recovery Time: 4ns; Average Rectified Current: 300mA; Power Rating: 400mW; Current Rating: 150mA; Output Current: 150mA; Max Reverse Voltage (DC): 100V; Series: -; Reverse Recovery Time-Max: 4ns; Length: 2.85mm; Width: 1.7mm; Height: 1.25mm; Radiation Hardening: No; RoHS Compliant: Yes; Reach SVHC Compliant: Yes; Lead Free: Lead Free; ComponentLink1URL: https://datasheet.ciiva.com/1179/1915529-1179304.pdf?src-supplier=Element14; ComponentLink1Description: https://datasheet.ciiva.com/1179/1915529-1179304.pdf?src-supplier=Element14; ComponentLink2URL: https://datasheet.ciiva.com/22695/1915529-22695239.pdf?src-supplier=Element14; ComponentLink2Description: https://datasheet.ciiva.com/22695/1915529-22695239.pdf?src-supplier=Element14; ComponentLink3URL: https://datasheet.ciiva.com/8300/ds30086-8300392.pdf?src-supplier=Avnet; ComponentLink3Description: https://datasheet.ciiva.com/8300/ds30086-8300392.pdf?src-supplier=Avnet; ComponentLink4URL: https://datasheet.ciiva.com/15219/getdatasheetpartid-110030-15219548.pdf?src-supplier=Verical; ComponentLink4Description: https://datasheet.ciiva.com/15219/getdatasheetpartid-110030-15219548.pdf?src-supplier=Verical; ComponentLink5URL: https://datasheet.ciiva.com/8303/ds30086-8303197.pdf?src-supplier=Avnet; ComponentLink5Description: https://datasheet.ciiva.com/8303/ds30086-8303197.pdf?src-supplier=Avnet; ComponentLink6URL: https://datasheet.ciiva.com/911/ds30086-911735.pdf?src-supplier=Digi-Key; ComponentLink6Description: https://datasheet.ciiva.com/911/ds30086-911735.pdf?src-supplier=Digi-Key; ComponentLink7URL: https://datasheet.ciiva.com/911/ds30086-911736.pdf?src-supplier=Digi-Key; ComponentLink7Description: https://datasheet.ciiva.com/911/ds30086-911736.pdf?src-supplier=Digi-Key; ComponentLink8URL: https://datasheet.ciiva.com/911/ds30086-911734.pdf?src-supplier=Digi-Key; ComponentLink8Description: https://datasheet.ciiva.com/911/ds30086-911734.pdf?src-supplier=Digi-Key; ComponentLink9URL: https://datasheet.ciiva.com/4435/ds30086-4435128.pdf?src-supplier=Mouser; ComponentLink9Description: https://datasheet.ciiva.com/4435/ds30086-4435128.pdf?src-supplier=Mouser; Supplier Part Number 1: 7634694; LCSC Part Number: C83528; Item Type: Diode
F2 = SMD0603-050: 6V 500mA 40A 1A 0603 Resettable Fuses ROHS; Manufacturer: TECHFUSE; Item Type: Fuse; Supplier 1: LCSC; Manufacturer Part Number: SMD0603-050; RoHS: No; Category: Uncategorized; Supplier Part Number 1: C69679; LCSC Part Number: C69679; ComponentLink1Description: LCSC; ComponentLink1URL: https://www.lcsc.com/product-detail/Resettable-Fuses_TECHFUSE-SMD0603-050_C69679.html
J34 = DB128V-5.08-5P-GN-S: 1x5P 20A -40℃~+105℃ 300V Green 12~30 Direct Insert 5.08mm 2.5 1 5 Plugin,P=5.08mm Screw Terminal Blocks ROHS; Manufacturer: DORABO; Manufacturer Part Number: DB128V-5.08-5P-GN-S; Package: Plugin,P=5.08mm; LCSC Part Number: C2927513; ComponentLink1Description: LCSC; ComponentLink1URL: https://www.lcsc.com/product-detail/Screw-Terminal-Blocks_DORABO-DB128V-5-08-5P-GN-S_C2927513.html; Item Type: Terminal Block
J35 J36 = DB128V-5.08-7P-GN-S: 1x7P 20A -40℃~+105℃ 300V Green 12~30 Direct Insert 5.08mm 2.5 1 7 Plugin,P=5.08mm Screw Terminal Blocks ROHS; Manufacturer: DORABO; Manufacturer Part Number: DB128V-5.08-7P-GN-S; Package: Plugin,P=5.08mm; LCSC Part Number: C2927514; ComponentLink1Description: LCSC; ComponentLink1URL: https://www.lcsc.com/product-detail/Screw-Terminal-Blocks_DORABO-DB128V-5-08-7P-GN-S_C2927514.html; Item Type: Terminal Block
J37 = DB128V-5.08-12P-GN-S: 1x12P 20A -40℃~+105℃ 300V Green 12~30 Direct Insert 5.08mm 2.5 1 12 Plugin,P=5.08mm Screw Terminal Blocks ROHS; Manufacturer: DIBO; Manufacturer Part Number: DB128V-5.08-12P-GN-S; Package: Plugin,P=5.08mm; LCSC Part Number: C2927515; Item Type: Terminal Block; ComponentLink1Description: LCSC; ComponentLink1URL: https://www.lcsc.com/product-detail/Screw-Terminal-Blocks_DORABO-DB128V-5-08-12P-GN-S_C2927515.html
J38 = DB128L-5.08-2P-OG-S: 1x2P 18A -40℃~+105℃ 250V Orange 12~30 Straight 5.08mm 2.5 1 2 Plugin,P=5.08mm Screw terminal ROHS; Manufacturer: DORABO; Item Type: Terminal Block; Manufacturer Part Number: DB128L-5.08-2P-OG-S; Package: Plugin,P=5.08mm; LCSC Part Number: C430603; ComponentLink1Description: LCSC; ComponentLink1URL: https://www.lcsc.com/product-detail/Screw-terminal_DORABO-DB128L-5-08-2P-OG-S_C430603.html
J39 = DB128L-5.08-2P-GY-S: 1x2P 20A -40℃~+105℃ 300V Gray 12~30 Straight 5.08mm 1~2.5 1 2 Plugin,P=5.08mm Screw terminal ROHS; Manufacturer: DORABO; Item Type: Terminal Block; Manufacturer Part Number: DB128L-5.08-2P-GY-S; Package: Plugin,P=5.08mm; LCSC Part Number: C500021; ComponentLink1Description: LCSC; ComponentLink1URL: https://www.lcsc.com/product-detail/Screw-terminal_DORABO-DB128L-5-08-2P-GY-S_C500021.html
J40 = DB128L-5.08-2P-GN-S: 1x2P 18A -40℃~+105℃ 250V Green 12~30 Straight 5.08mm 2.5 1 2 Plugin,P=5.08mm Screw terminal ROHS; Manufacturer: DORABO; Item Type: Terminal Block; Manufacturer Part Number: DB128L-5.08-2P-GN-S; Package: Plugin,P=5.08mm; LCSC Part Number: C395868; ComponentLink1Description: LCSC; ComponentLink1URL: https://www.lcsc.com/product-detail/Screw-terminal_DORABO-DB128L-5-08-2P-GN-S_C395868.html
J41 = DB128L-5.08-2P-BK-S: 1x2P 18A -40℃~+105℃ 250V Black 12~30 Straight pin 5.08mm 2.5 1 2 Plugin,P=5.08mm Screw terminal ROHS; Manufacturer: DIBO; Item Type: Terminal Block; Manufacturer Part Number: DB128L-5.08-2P-BK-S; Package: Plugin,P=5.08mm; LCSC Part Number: C430601; ComponentLink1Description: LCSC; ComponentLink1URL: https://www.lcsc.com/product-detail/Screw-terminal_span-style-background-color-ff0-DIBO-span-DB128L-5-08-2P-BK-S_C430601.html
Q7-Q10 = AO3401: Trans Mosfet P-ch 30V 4A 3-PIN SOT-23 T/r; Manufacturer: Alpha & Omega Semiconductor; Manufacturer Part Number: AO3401A; Rds On Max: 44mR; Input Capacitance: 1.2nF; Max Power Dissipation: 1.4W; Number of Elements: 1; Supplier 1: Arrow Electronics; RoHS: Yes; Category: MOSFETs; Mount: Surface Mount; Case/Package: TO-236-3; Number of Pins: 3; Min Operating Temperature: -55°C; Max Operating Temperature: 150°C; Packaging: Tape and Reel; Drain to Source Voltage (Vdss): 30V; Continuous Drain Current (ID): 4A; Power Dissipation: 1.4W; Series: -; Radiation Hardening: No; RoHS Compliant: Yes; Lead Free: Lead Free; ComponentLink1URL: https://datasheet.ciiva.com/940/ao3401a-940720.pdf?src-supplier=Digi-Key; ComponentLink1Description: https://datasheet.ciiva.com/940/ao3401a-940720.pdf?src-supplier=Digi-Key; ComponentLink2URL: https://datasheet.ciiva.com/26927/getdatasheetpartid-79048-26927888.pdf?src-supplier=Verical; ComponentLink2Description: https://datasheet.ciiva.com/26927/getdatasheetpartid-79048-26927888.pdf?src-supplier=Verical; Supplier Part Number 1: AO3401A; LCSC Part Number: C181091; Item Type: Mosfet
Q11-Q14 = MMBT3904: 40V 200mW 100 200mA NPN SOT-23 Bipolar (BJT) ROHS; Manufacturer: ElecSuper; Item Type: (BJT); Manufacturer Part Number: MMBT3904; Package: SOT-23; LCSC Part Number: C5249683; ComponentLink1Description: LCSC; ComponentLink1URL: https://www.lcsc.com/product-detail/Bipolar-BJT_ElecSuper-MMBT3904_C5249683.html
R385-R388 = RC0402FR-0720KL: RES 20K OHM 1% 1/16W 0402; Manufacturer: Yageo; Resistance: 20kR; Power Rating: 62.5mW; Voltage Rating: 50V; Temperature Coefficient: 100ppm/°C; Max Power Dissipation: 63mW; Item Type: Resistor; Supplier 1: Avnet; Manufacturer Part Number: RC0402FR-0720KL; RoHS: Yes; Category: Chip SMD Resistors; Stock 1: 1960708; Pricing 1: 10000=0.00085 (USD); Case/Package: 0402; Number of Pins: 2; Case Code (Metric): 1005; Case Code (Imperial): 0402; Size Code: 0402; Min Operating Temperature: -55°C; Max Operating Temperature: 155°C; Tolerance: 1%; Package Quantity: 1; Packaging: Tape and Reel; Resistor Type: Thick Film; Number of Terminations: 2; Termination: SMD/SMT; Voltage Rating (DC): 50V; Features: Moisture Resistant; Series: RC; Technology: THICK FILM; Resistance Tolerance: 1%; Construction: Rectangular; Length: 1mm; Width: 0.02inch; Height: 0.016inch; Depth: 0.5mm; RoHS Compliant: Yes; Reach SVHC Compliant: Yes; Military Standard: Not; Lead Free: Lead Free; ComponentLink1URL: https://datasheet.ciiva.com/11808/0900766b80c66297-11808454.pdf?src-supplier=RSComponents; ComponentLink1Description: https://datasheet.ciiva.com/11808/0900766b80c66297-11808454.pdf?src-supplier=RSComponents; ComponentLink2URL: https://datasheet.ciiva.com/7983/1018594-7983511.pdf?src-supplier=Element14; ComponentLink2Description: https://datasheet.ciiva.com/7983/1018594-7983511.pdf?src-supplier=Element14; ComponentLink3URL: https://datasheet.ciiva.com/46394/1018594-46394974.pdf?src-supplier=Element14; ComponentLink3Description: https://datasheet.ciiva.com/46394/1018594-46394974.pdf?src-supplier=Element14; ComponentLink4URL: https://datasheet.ciiva.com/2453/pyu-r-int-thick-7-2453494.pdf?src-supplier=Digi-Key; ComponentLink4Description: https://datasheet.ciiva.com/2453/pyu-r-int-thick-7-2453494.pdf?src-supplier=Digi-Key; ComponentLink5URL: https://datasheet.ciiva.com/2453/pyu-r-int-thick-7-2453495.pdf?src-supplier=Digi-Key; ComponentLink5Description: https://datasheet.ciiva.com/2453/pyu-r-int-thick-7-2453495.pdf?src-supplier=Digi-Key; ComponentLink6URL: https://datasheet.ciiva.com/2453/pyu-r-int-thick-7-2453493.pdf?src-supplier=Digi-Key; ComponentLink6Description: https://datasheet.ciiva.com/2453/pyu-r-int-thick-7-2453493.pdf?src-supplier=Digi-Key; ComponentLink7URL: https://datasheet.ciiva.com/12558/pyu-rc0402-51-rohs-l-6-r-8721-12558796.pdf?src-supplier=Mouser; ComponentLink7Description: https://datasheet.ciiva.com/12558/pyu-rc0402-51-rohs-l-6-r-8721-12558796.pdf?src-supplier=Mouser; Supplier Part Number 1: RC0402FR-0720KL; LCSC Part Number: C93942
R389-R392 R406 R407 R412 R413 = RC0402FR-074K7L: RES 4.7K OHM 1% 1/16W 0402; Manufacturer: Yageo; Voltage Rating (DC): 50V; Power Rating: 62.5mW; Resistance: 4.7kR; Temperature Coefficient: 100ppm/°C; Max Power Dissipation: 63mW; Item Type: Resistor; Supplier 1: Avnet; Manufacturer Part Number: RC0402FR-074K7L; RoHS: Yes; Category: Chip SMD Resistors; Stock 1: 2420000; Pricing 1: 10000=0.00085 (USD); Case/Package: 0402; Number of Pins: 2; Case Code (Imperial): 0402; Case Code (Metric): 1005; Size Code: 0402; Min Operating Temperature: -55°C; Max Operating Temperature: 155°C; Tolerance: 1%; Voltage Rating: 50V; Packaging: Tape and Reel; Resistor Type: Thick Film; Termination: SMD/SMT; Features: Moisture Resistant; Series: RC; Number of Terminations: 2; Resistance Tolerance: 1%; Construction: Rectangular; Length: 1mm; Width: 0.5mm; Height: 0.32mm; Depth: 0.5mm; Height - Seated (Max): 0.016inch; RoHS Compliant: Yes; Reach SVHC Compliant: Yes; Military Standard: Not; Lead Free: Lead Free; ComponentLink1URL: https://datasheet.ciiva.com/22661/1686128-22661342.pdf?src-supplier=Element14; ComponentLink1Description: https://datasheet.ciiva.com/22661/1686128-22661342.pdf?src-supplier=Element14; ComponentLink2URL: https://datasheet.ciiva.com/7850/1018594-7850022.pdf?src-supplier=Element14; ComponentLink2Description: https://datasheet.ciiva.com/7850/1018594-7850022.pdf?src-supplier=Element14; ComponentLink3URL: https://datasheet.ciiva.com/7850/1018594-7850023.pdf?src-supplier=Element14; ComponentLink3Description: https://datasheet.ciiva.com/7850/1018594-7850023.pdf?src-supplier=Element14; ComponentLink4URL: https://datasheet.ciiva.com/15215/getdatasheetpartid-328119-15215035.pdf?src-supplier=Verical; ComponentLink4Description: https://datasheet.ciiva.com/15215/getdatasheetpartid-328119-15215035.pdf?src-supplier=Verical; Supplier Part Number 1: RC0402FR-074K7L; LCSC Part Number: C105871
R393-R404 = RC0402FR-07100RL: RES 100 OHM 1% 1/16W 0402; Manufacturer: Yageo; Power Rating: 62.5mW; Voltage Rating: 50V; Temperature Coefficient: 100ppm/°C; Max Power Dissipation: 63mW; Item Type: Resistor; Supplier 1: Mouser; Manufacturer Part Number: RC0402FR-07100RL; RoHS: Yes; Category: Chip SMD Resistors; Stock 1: 699545; Pricing 1: 1=0.10000, 10=0.01200, 50=0.01200, 100=0.00500, 1000=0.00300, 2500=0.00200, 10000=0.00100 (USD); Case/Package: 0402; Number of Pins: 2; Case Code (Imperial): 0402; Case Code (Metric): 1005; Size Code: 0402; Min Operating Temperature: -55°C; Max Operating Temperature: 155°C; Tolerance: 1%; Voltage Rating (DC): 50V; Resistance: 100R; Packaging: Tape and Reel; Termination: SMD/SMT; Resistor Type: Thick Film; Features: Moisture Resistant; Series: RC; Number of Terminations: 2; Resistance Tolerance: 1%; Construction: Rectangular; Technology: THICK FILM; Length: 1mm; Width: 0.5mm; Height: 0.32mm; Depth: 0.5mm; RoHS Compliant: Yes; REACH SVHC: No SVHC; Military Standard: Not; Lead Free: Lead Free; ComponentLink1URL: https://datasheet.ciiva.com/11808/0900766b80c66297-11808765.pdf?src-supplier=RSComponents; ComponentLink1Description: https://datasheet.ciiva.com/11808/0900766b80c66297-11808765.pdf?src-supplier=RSComponents; ComponentLink2URL: https://datasheet.ciiva.com/7849/1784430-7849810.pdf?src-supplier=Element14; ComponentLink2Description: https://datasheet.ciiva.com/7849/1784430-7849810.pdf?src-supplier=Element14; ComponentLink3URL: https://datasheet.ciiva.com/28367/1018594-28367226.pdf?src-supplier=Element14; ComponentLink3Description: https://datasheet.ciiva.com/28367/1018594-28367226.pdf?src-supplier=Element14; ComponentLink4URL: https://datasheet.ciiva.com/22747/1018594-22747511.pdf?src-supplier=Element14; ComponentLink4Description: https://datasheet.ciiva.com/22747/1018594-22747511.pdf?src-supplier=Element14; ComponentLink5URL: https://datasheet.ciiva.com/12667/pyu-rc0402-51-rohs-l-6-r-12667957.pdf?src-supplier=Mouser; ComponentLink5Description: https://datasheet.ciiva.com/12667/pyu-rc0402-51-rohs-l-6-r-12667957.pdf?src-supplier=Mouser; ComponentLink6URL: https://datasheet.ciiva.com/15189/getdatasheetpartid-329466-15189335.pdf?src-supplier=Verical; ComponentLink6Description: https://datasheet.ciiva.com/15189/getdatasheetpartid-329466-15189335.pdf?src-supplier=Verical; ComponentLink7URL: https://datasheet.ciiva.com/16740/pyu-rc0402-51-rohs-l-6-r-16740566.pdf?src-supplier=Future+Electronics; ComponentLink7Description: https://datasheet.ciiva.com/16740/pyu-rc0402-51-rohs-l-6-r-16740566.pdf?src-supplier=Future+Electronics; Supplier Part Number 1: 603-RC0402FR-07100RL; LCSC Part Number: C106232
R405 R410 R411 R416 = RC0603JR-07120RL: RES 120 OHM 5% 1/10W 0603; Manufacturer: Yageo; Voltage Rating (AC): 50V; Item Type: Resistor; Supplier: Future Electronics; Supplier Part Number: 4045720; Manufacturer Part Number: RC0603JR-07120RL; RoHS: Yes; Category: Chip SMD Resistors; Stock: 570000; Pricing: 5000=0.0015, 75000=0.0015, 250000=0.0014, 750000=0.0013, 2500000=0.0012 (USD); ComponentLink1URL: https://datasheet.ciiva.com/15189/getdatasheetpartid-326532-15189850.pdf?src-supplier=Verical; ComponentLink1Description: https://datasheet.ciiva.com/15189/getdatasheetpartid-326532-15189850.pdf?src-supplier=Verical; ComponentLink2URL: https://datasheet.ciiva.com/2518/pyu-r-int-thick-7-2518850.pdf?src-supplier=Digi-Key; ComponentLink2Description: https://datasheet.ciiva.com/2518/pyu-r-int-thick-7-2518850.pdf?src-supplier=Digi-Key; ComponentLink3URL: https://datasheet.ciiva.com/2518/pyu-r-int-thick-7-2518851.pdf?src-supplier=Digi-Key; ComponentLink3Description: https://datasheet.ciiva.com/2518/pyu-r-int-thick-7-2518851.pdf?src-supplier=Digi-Key; ComponentLink4URL: https://datasheet.ciiva.com/2518/pyu-r-int-thick-7-2518852.pdf?src-supplier=Digi-Key; ComponentLink4Description: https://datasheet.ciiva.com/2518/pyu-r-int-thick-7-2518852.pdf?src-supplier=Digi-Key; ComponentLink5URL: https://datasheet.ciiva.com/46395/443971-46395070.pdf?src-supplier=Element14; ComponentLink5Description: https://datasheet.ciiva.com/46395/443971-46395070.pdf?src-supplier=Element14; ComponentLink6URL: https://datasheet.ciiva.com/12555/rc0603-272842-12555246.pdf?src-supplier=Mouser; ComponentLink6Description: https://datasheet.ciiva.com/12555/rc0603-272842-12555246.pdf?src-supplier=Mouser; LCSC Part Number: C114681
R408 R409 R414 R415 = 0402WGF4301TCE: 62.5mW Thick Film Resistors 50V ±100ppm/℃ ±1% 4.3kΩ 0402 Chip Resistor - Surface Mount ROHS; Manufacturer: Royal Electronic Factory; Value: 4.3kR; Temperature Coefficient: 100ppm/°C; Supplier: Mouser; Supplier Part Number: 303-0402WGF4301TCE; Manufacturer Part Number: 0402WGF4301TCE; RoHS: No; Item Type: Resistor; Pricing: 10000=0.004 (USD); ComponentLink1URL: http://datasheet.octopart.com/0402WGF4301TCE-Royal-Ohm-datasheet-17591902.pdf?src-supplier=Mouser; ComponentLink1Description: http://datasheet.octopart.com/0402WGF4301TCE-Royal-Ohm-datasheet-17591902.pdf?src-supplier=Mouser; ComponentLink2URL: https://datasheet.octopart.com/0402WGF4301TCE-Royal-Ohm-datasheet-165785611.pdf?src-supplier=TME; ComponentLink2Description: https://datasheet.octopart.com/0402WGF4301TCE-Royal-Ohm-datasheet-165785611.pdf?src-supplier=TME; LCSC Part Number: C25899
TP15-TP18 = TEST POINT: Test Point ON; Item Type: TEST POINT
U32-U35 = PC817C: 70V 5kV 50mA 100mV@1mA,20mA 1 6V 1.2V DC SMD-4 Transistor Output Optocoupler ROHS; Manufacturer: Slkor; Item Type: IC; Manufacturer Part Number: PC817C; Package: SMD-4; LCSC Part Number: C2936043; ComponentLink1Description: LCSC; ComponentLink1URL: https://www.lcsc.com/product-detail/Transistor-Output-Optocoupler_Slkor-SLKORMICRO-Elec-PC817C_C2936043.html